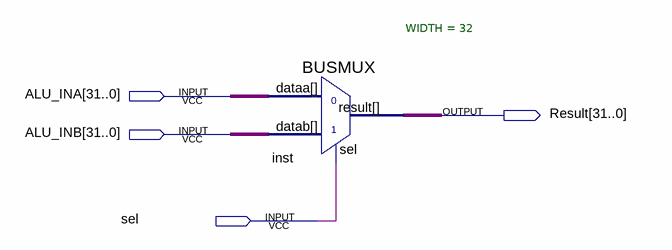
[diagram p0: schematic sheet]
// Quartus schematic ALU_OUT_MUX.bdf as structural Verilog: 1 symbols, 4 pins
module ALU_OUT_MUX (
  input  [31:0] ALU_INA,
  input  [31:0] ALU_INB,
  input  sel,
  output [31:0] Result
);

  BUSMUX #(.WIDTH(32)) inst (.datab(ALU_INB), .sel(sel), .dataa(ALU_INA), .result(Result));
endmodule
